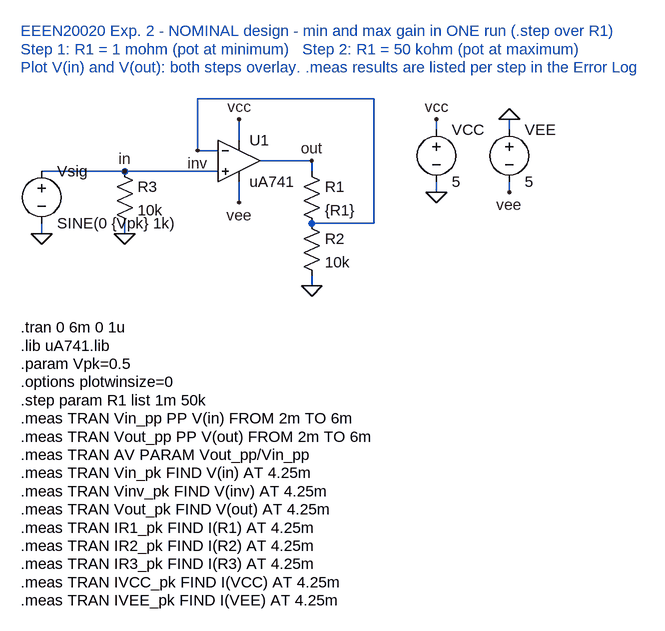
[diagram p0: schematic exp2_nominal_step.asc]
exp2_nominal_step.asc, the LTspice schematic file:
Version 4
SHEET 1 1240 900
WIRE 96 240 224 240
WIRE 224 240 368 240
WIRE 432 224 512 224
WIRE 512 224 512 240
WIRE 368 208 336 208
WIRE 336 208 336 128
WIRE 336 128 608 128
WIRE 608 128 608 320
WIRE 608 320 512 320
WIRE 400 192 400 160
WIRE 400 256 400 288
WIRE 704 176 704 160
WIRE 704 256 704 272
WIRE 816 176 816 160
WIRE 816 256 816 272
WIRE 96 320 96 336
WIRE 224 320 224 336
WIRE 512 400 512 416
FLAG 96 336 0
FLAG 224 336 0
FLAG 512 416 0
FLAG 704 272 0
FLAG 816 160 0
FLAG 224 240 in
FLAG 512 224 out
FLAG 336 208 inv
FLAG 400 160 vcc
FLAG 704 160 vcc
FLAG 400 288 vee
FLAG 816 272 vee
SYMBOL voltage 96 224 R0
SYMATTR InstName Vsig
SYMATTR Value SINE(0 {Vpk} 1k)
SYMBOL res 208 224 R0
SYMATTR InstName R3
SYMATTR Value 10k
SYMBOL Opamps\\opamp2 400 160 R0
SYMATTR InstName U1
SYMATTR Value uA741
SYMBOL res 496 224 R0
SYMATTR InstName R1
SYMATTR Value {R1}
SYMBOL res 496 304 R0
SYMATTR InstName R2
SYMATTR Value 10k
SYMBOL voltage 704 160 R0
SYMATTR InstName VCC
SYMATTR Value 5
SYMBOL voltage 816 160 R0
SYMATTR InstName VEE
SYMATTR Value 5
TEXT 64 24 Left 2 ;EEEN20020 Exp. 2 - NOMINAL design - min and max gain in ONE run (.step over R1)
TEXT 64 52 Left 2 ;Step 1: R1 = 1 mohm (pot at minimum)   Step 2: R1 = 50 kohm (pot at maximum)
TEXT 64 80 Left 2 ;Plot V(in) and V(out): both steps overlay. .meas results are listed per step in the Error Log
TEXT 64 480 Left 2 !.tran 0 6m 0 1u
TEXT 64 508 Left 2 !.lib uA741.lib
TEXT 64 536 Left 2 !.param Vpk=0.5
TEXT 64 564 Left 2 !.options plotwinsize=0
TEXT 64 592 Left 2 !.step param R1 list 1m 50k
TEXT 64 620 Left 2 !.meas TRAN Vin_pp PP V(in) FROM 2m TO 6m
TEXT 64 648 Left 2 !.meas TRAN Vout_pp PP V(out) FROM 2m TO 6m
TEXT 64 676 Left 2 !.meas TRAN AV PARAM Vout_pp/Vin_pp
TEXT 64 704 Left 2 !.meas TRAN Vin_pk FIND V(in) AT 4.25m
TEXT 64 732 Left 2 !.meas TRAN Vinv_pk FIND V(inv) AT 4.25m
TEXT 64 760 Left 2 !.meas TRAN Vout_pk FIND V(out) AT 4.25m
TEXT 64 788 Left 2 !.meas TRAN IR1_pk FIND I(R1) AT 4.25m
TEXT 64 816 Left 2 !.meas TRAN IR2_pk FIND I(R2) AT 4.25m
TEXT 64 844 Left 2 !.meas TRAN IR3_pk FIND I(R3) AT 4.25m
TEXT 64 872 Left 2 !.meas TRAN IVCC_pk FIND I(VCC) AT 4.25m
TEXT 64 900 Left 2 !.meas TRAN IVEE_pk FIND I(VEE) AT 4.25m

The netlist it stands for:
* exp2_nominal_step.asc
Vsig in 0 SINE(0 {Vpk} 1k)
R3 in 0 10k
XU1 in inv vcc vee out uA741  ; pins In+ In- V+ V- OUT
R1 out inv {R1}
R2 inv 0 10k
VCC vcc 0 5
VEE 0 vee 5
* EEEN20020 Exp. 2 - NOMINAL design - min and max gain in ONE run (.step over R1)
* Step 1: R1 = 1 mohm (pot at minimum)   Step 2: R1 = 50 kohm (pot at maximum)
* Plot V(in) and V(out): both steps overlay. .meas results are listed per step in the Error Log
.tran 0 6m 0 1u
.lib uA741.lib
.param Vpk=0.5
.options plotwinsize=0
.step param R1 list 1m 50k
.meas TRAN Vin_pp PP V(in) FROM 2m TO 6m
.meas TRAN Vout_pp PP V(out) FROM 2m TO 6m
.meas TRAN AV PARAM Vout_pp/Vin_pp
.meas TRAN Vin_pk FIND V(in) AT 4.25m
.meas TRAN Vinv_pk FIND V(inv) AT 4.25m
.meas TRAN Vout_pk FIND V(out) AT 4.25m
.meas TRAN IR1_pk FIND I(R1) AT 4.25m
.meas TRAN IR2_pk FIND I(R2) AT 4.25m
.meas TRAN IR3_pk FIND I(R3) AT 4.25m
.meas TRAN IVCC_pk FIND I(VCC) AT 4.25m
.meas TRAN IVEE_pk FIND I(VEE) AT 4.25m
.backanno
.end